# Altium schematic sheet S8_Usb_Select.SchDoc
size 420 x 297 mm; SheetNumber: 8; SheetTotal: 11
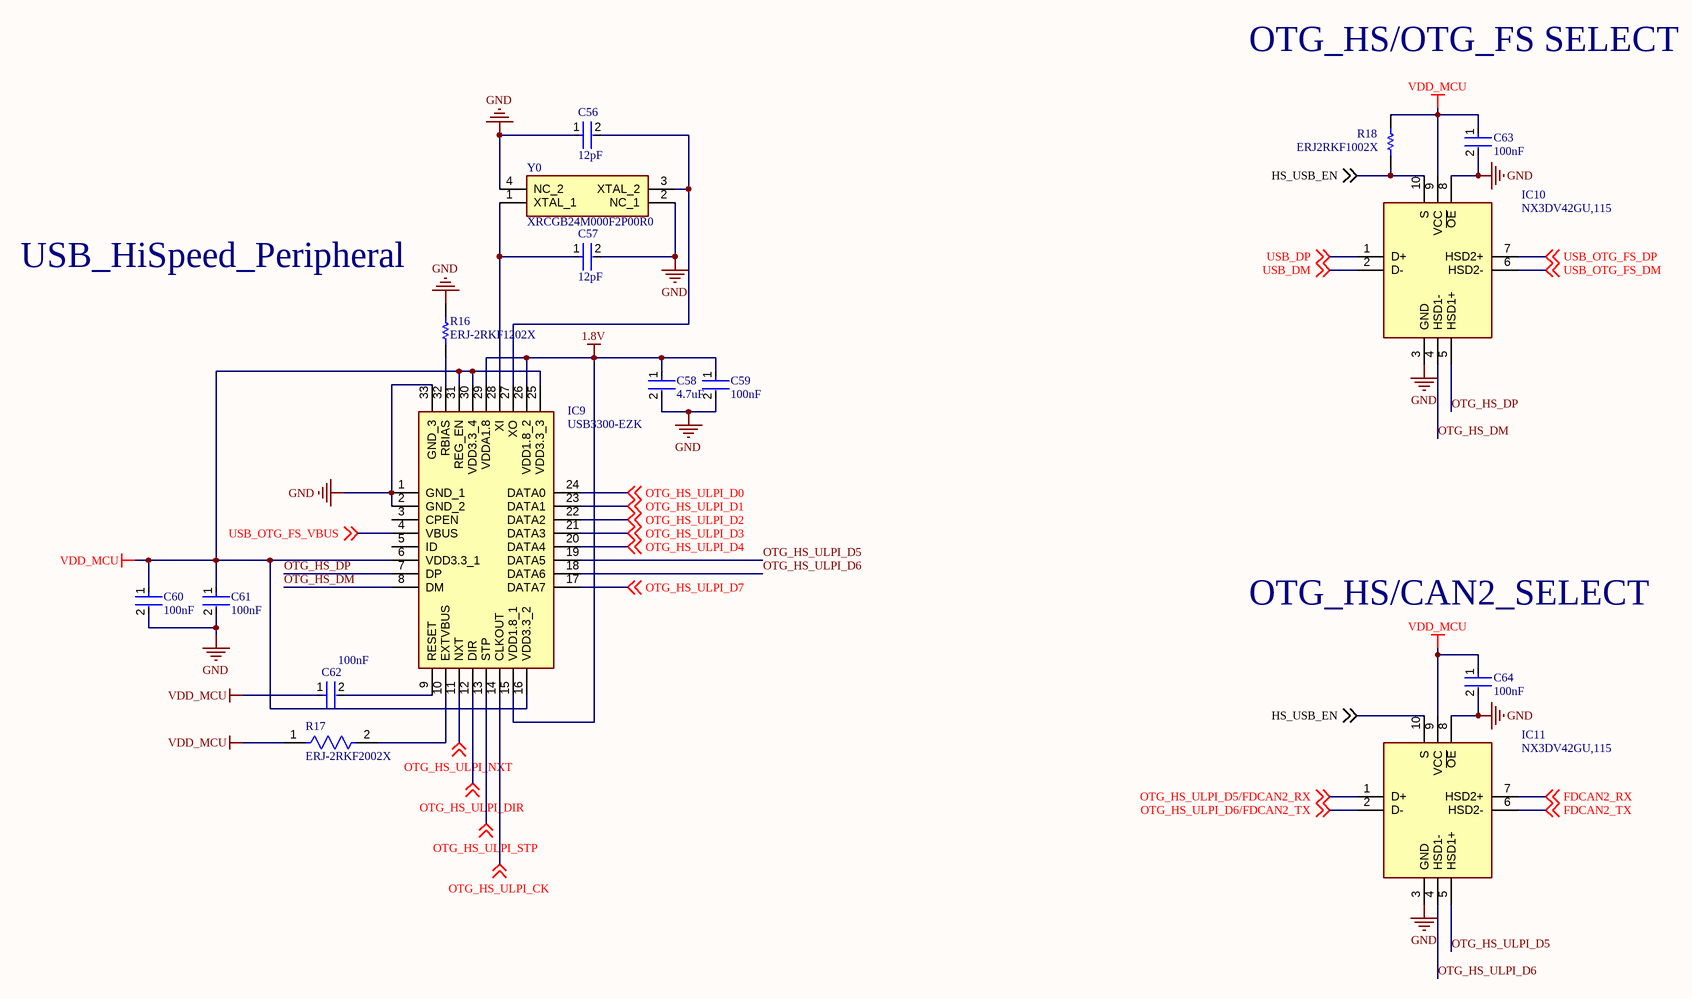
[diagram p0: S8_Usb_Select.SchDoc]

## Parts
C56  12pF  [FP-GRM155-0_05-MFG]
C57  12pF  [FP-GRM155-0_05-MFG]
C58  4.7uF  [FP-CC0402-MFG]
C59  100nF  [FP-CC0402-MFG]
C60  100nF  [FP-CC0402-MFG]
C61  100nF  [FP-CC0402-MFG]
C62  100nF  [FP-CC0402-MFG]
C63  100nF  [FP-CC0402-MFG]
C64  100nF  [FP-CC0402-MFG]
IC9  USB3300-EZK  [QFN50P500X500X100-33N-D]
IC10  NX3DV42GU,115  [QFN40P140X180X50-10N]
IC11  NX3DV42GU,115  [QFN40P140X180X50-10N]
R16  ERJ-2RKF1202X  [RESC1005X40X25ML05T05]
R17  ERJ-2RKF2002X  [FP-ERJ2RK-MFG]
R18  ERJ2RKF1002X  [RESC1005X40X25LL05T05]
Y0  XRCGB24M000F2P00R0  [XRCGB]

## Nets
1.8V: C58.1 C59.1 IC9.15(VDD1.8_1) IC9.26(VDD1.8_2) IC9.29(VDDA1.8)
GND: C56.1 C57.2 C58.2 C59.2 C60.2 C61.2 C63.2 C64.2 IC9.1(GND_1) IC9.2(GND_2) IC9.33(GND_3) IC10.3(GND) IC10.8(~{OE}) IC11.3(GND) IC11.8(~{OE}) R16.2 Y0.2(NC_1) Y0.4(NC_2)
VDD_MCU: C60.1 C61.1 C62.1 C63.1 C64.1 IC9.6(VDD3.3_1) IC9.16(VDD3.3_2) IC9.25(VDD3.3_3) IC9.30(VDD3.3_4) IC9.31(REG_EN) IC10.9(VCC) IC11.9(VCC) R17.1 R18.2
FDCAN2_RX: IC11.7(HSD2+) ; off-sheet FDCAN2_RX
FDCAN2_TX: IC11.6(HSD2-) ; off-sheet FDCAN2_TX
HS_USB_EN: IC10.10(S) IC11.10(S) R18.1 ; off-sheet HS_USB_EN
OTG_HS_DM: IC9.8(DM) IC10.4(HSD1-)
OTG_HS_DP: IC9.7(DP) IC10.5(HSD1+)
OTG_HS_ULPI_CK: IC9.14(CLKOUT) ; off-sheet OTG_HS_ULPI_CK
OTG_HS_ULPI_D0: IC9.24(DATA0) ; off-sheet OTG_HS_ULPI_D0
OTG_HS_ULPI_D1: IC9.23(DATA1) ; off-sheet OTG_HS_ULPI_D1
OTG_HS_ULPI_D2: IC9.22(DATA2) ; off-sheet OTG_HS_ULPI_D2
OTG_HS_ULPI_D3: IC9.21(DATA3) ; off-sheet OTG_HS_ULPI_D3
OTG_HS_ULPI_D4: IC9.20(DATA4) ; off-sheet OTG_HS_ULPI_D4
OTG_HS_ULPI_D5: IC9.19(DATA5) IC11.5(HSD1+)
OTG_HS_ULPI_D5/FDCAN2_RX: IC11.1(D+) ; off-sheet OTG_HS_ULPI_D5/FDCAN2_RX
OTG_HS_ULPI_D6: IC9.18(DATA6) IC11.4(HSD1-)
OTG_HS_ULPI_D6/FDCAN2_TX: IC11.2(D-) ; off-sheet OTG_HS_ULPI_D6/FDCAN2_TX
OTG_HS_ULPI_D7: IC9.17(DATA7) ; off-sheet OTG_HS_ULPI_D7
OTG_HS_ULPI_DIR: IC9.12(DIR) ; off-sheet OTG_HS_ULPI_DIR
OTG_HS_ULPI_NXT: IC9.11(NXT) ; off-sheet OTG_HS_ULPI_NXT
OTG_HS_ULPI_STP: IC9.13(STP) ; off-sheet OTG_HS_ULPI_STP
USB_DM: IC10.2(D-) ; off-sheet USB_DM
USB_DP: IC10.1(D+) ; off-sheet USB_DP
USB_OTG_FS_DM: IC10.6(HSD2-) ; off-sheet USB_OTG_FS_DM
USB_OTG_FS_DP: IC10.7(HSD2+) ; off-sheet USB_OTG_FS_DP
USB_OTG_FS_VBUS: IC9.4(VBUS) ; off-sheet USB_OTG_FS_VBUS
NetC56_2: C56.2 IC9.27(XO) Y0.3(XTAL_2)
NetC57_1: C57.1 IC9.28(XI) Y0.1(XTAL_1)
NetC62_2: C62.2 IC9.9(RESET)
NetIC9_10: IC9.10(EXTVBUS) R17.2
NetIC9_32: IC9.32(RBIAS) R16.1

Not connected (* = marked no-connect by the designer): IC9 3(CPEN) 5(ID)

## Notes on the sheet
- OTG_HS/OTG_FS SELECT
- (near R16) USB_HiSpeed_Peripheral
- OTG_HS/CAN2_SELECT
- THIS DOCUMENT AND THE DATA DISCLOSED HEREIN OR
- HEREWITH IS THE PROPERTY OF ALTIUM LIMITED AND MAY
- DWG NO:
- REVISION
- REV:
- DESCRIPTION
- DATE
- APPROVED
- BE FREELY DISTRIBUTED IN WHOLE. NO RIGHTS ARE
- RESERVED OR EXPRESS OR IMPLIED WARANTEE GIVEN.
- ENG:
- APPROVALS
- PROJECT
- DSN:
- CHK:
- REFERENCE DOCUMENTS
- PROJECT REVISION:
- TITLE
- DOCUMENT REVISION:
- DESIGN ITEM:
- BOM:
- FAB DWG:
- PCB DWG:
- ASSY DWG:
- SCALE:
- A3
- SIZE
- CAGE CODE
- FILE NAME
- DWG NO.
- SHEET
- OF
- REV

## Library data of the parts
C56 C57 = CMP-2008-03945-2: CAP CER 12PF 50V C0G/NP0 0402; Tolerance: 2%; Dielectric: C0G; Material: Ceramic; Termination: SMD/SMT; Mount: Surface Mount; REACH SVHC: No SVHC; Depth: 0.5mm; Case Code (Metric): 1005; Voltage Rating: 50V; Height: 0.5mm; Voltage Rating (DC): 50V; Case Code (Imperial): 0402; Package Quantity: 10000; Construction: Flat; Thickness: 0.022inch; Length: 1mm; Min Operating Temperature: -55°C; Width: 0.5mm; Lead Free: Lead Free; Capacitance: 12pF; Case/Package: 0402; Packaging: Tape and Reel; Series: GRM; Voltage: 50V; Radiation Hardening: No; Max Operating Temperature: 125°C
C58 = CMP-1034-02137-2: CAP CER 4.7UF 6.3V X5R 0402; Manufacturer: YAGEO; Manufacturer Part Number: CC0402MRX5R5BB475; Temperature Coefficient: 30ppm/°C; Tolerance: 0.2; Automotive Grade: NA; Material: Ceramic; Automotive: No; Temperature: -55°C to +125°C; Category: Cap; Ipc Land Pattern Name: CAPC10050X50; Digikey Description: CAP CER 4.7UF 6.3V X5R 0402; ComponentLink2Description: Datasheet; Octopart: https://octopart.com/cc0402mrx5r5bb475-yageo-20021081; Mouser Description: Multilayer Ceramic Capacitors MLCC - SMD/SMT 4.7uF 6.3V X5R 20%; Device Class L1: Passive Components; Footprint Url: http://www.yageo.com/exep/pages/download/literatures/UPY-C_GEN_24.pdf; Value: 4.7 uF; Temperature Range High: +125°C; ComponentLink2URL: http://www.yageo.com/documents/recent/UPY-GP_NP0_16V-to-50V_16.pdf; Voltage Rating: 6.3 V; Height: 0.55mm; RoHS: TRUE; Package: CC0402; Device Class L3: Ceramic Capacitors; Temperature Characteristic: X5R; Temperature Range Low: -55°C; Capacitance: 4.7 uF; Device Class L2: Capacitors; Lead Free: Yes
C59-C64 = CMP-03422-001121-1: CAP CER 0.1UF 16V X7R 0402; Manufacturer: YAGEO; Manufacturer Part Number: CC0402KPX7R7BB104; Material: Ceramic; Temperature Coefficient: 30ppm/°C; Automotive Grade: NA; Tolerance: 0.1; Digikey Description: CAP CER 0.1UF 16V X7R 0402; Temperature Range Low: -55°C; Footprint Url: http://www.yageo.com/exep/pages/download/literatures/UPY-C_GEN_24.pdf; RoHS: TRUE; Device Class L3: Ceramic Capacitors; Temperature Characteristic: X7R; Capacitance: 100 nF; Package: CC0402; Device Class L1: Passive Components; Lead Free: Yes; Temperature Range High: +125°C; Category: Cap; Mouser Description: 0402 0.1 uF 16 V ±10% Tolerance X7R SMT Multilayer Ceramic Capacitor; Voltage Rating: 16 V; Value: 100 nF; ComponentLink2Description: Datasheet; Automotive: No; Octopart: https://octopart.com/cc0402kpx7r7bb104-yageo-21548559; ComponentLink2URL: http://www.yageo.com/documents/recent/UPY-GP_NP0_16V-to-50V_16.pdf; Height: 0.55mm; Device Class L2: Capacitors; Temperature: -55°C to +125°C; Ipc Land Pattern Name: CAPC10050X50
IC9 = USB3300-EZK: Integrated Circuit; Manufacturer_Name: Microchip; Datasheet Link: http://www.microchip.com/mymicrochip/filehandler.aspx?ddocname=en562663; Height: 1mm; Manufacturer_Part_Number: USB3300-EZK; Mouser Part Number: 886-USB3300-EZK; Mouser Price/Stock: https://www.mouser.co.uk/ProductDetail/Microchip-Technology/USB3300-EZK?qs=pA5MXup5wxFkdKvPjm4n2w%3D%3D; Arrow Part Number: USB3300-EZK; Arrow Price/Stock: https://www.arrow.com/en/products/usb3300-ezk/microchip-technology?region=europe
IC10 IC11 = NX3DV42GU,115: Integrated Circuit; Manufacturer_Name: NXP; Datasheet Link: http://www.nxp.com/docs/en/data-sheet/NX3DV42.pdf; Height: 0.5mm; Manufacturer_Part_Number: NX3DV42GU,115; Mouser Part Number: 771-NX3DV42GU115; Mouser Price/Stock: https://www.mouser.co.uk/ProductDetail/NXP-Semiconductors/NX3DV42GU115?qs=cbprxTG2Yq%252BinzuyAklGVQ%3D%3D; Arrow Part Number: NX3DV42GU,115; Arrow Price/Stock: https://www.arrow.com/en/products/nx3dv42gu115/nxp-semiconductors?region=nac
R16 = CMP-2002-00646-4: Chip Resistor, 12 KOhm, +/- 1%, 0.1 W, -55 to 155 degC, 0402 (1005 Metric), RoHS, Tape and Reel; Resistance: 12 KOhm; Voltage Rating: 50 V; Case\/Package: 0402; Power Rating: 100 mW; Length: 1 mm; PackageReference: 0402; DatasheetVersion: 04/2015; ComponentLink2Description: Datasheet; ComponentLink1URL: http://www.panasonic.com/; Pins: 2; Width: 0.5 mm; REACH SVHC: Yes; Packaging: Tape and Reel; Min Operating Temperature: -55 degC; Mounting Technology: Surface Mount; Max Operating Temperature: 155 degC; Case Code (Imperial): 0402; Height: 0.35 mm; Tolerance: 1%; PackageDescription: 2-Pin Surface Mount Device, Body 1 x 0.5 mm; RoHSCompliant: true; ComponentLink1Description: Manufacturer URL; Mount: Surface Mount; ComponentLink2URL: http://industrial.panasonic.com/cdbs/www-data/pdf/RDA0000/AOA0000C86.pdf; Package Quantity: 10000; Case Code (Metric): 1005; PartNumber: ERJ-2RKF1202X
R17 = CMP-2002-00759-4: RES SMD 20K OHM 1% 1/10W 0402; Resistance: 20kR; Voltage Rating (DC): 50V; Power Rating: 100mW; Temperature Coefficient: 100ppm/°C; Radiation Hardening: No; Case/Package: 0402; Case Code (Metric): 1005; Min Operating Temperature: -55°C; Termination: SMD/SMT; Package Quantity: 1; Length: 1mm; Case Code (Imperial): 0402; Lead Free: Lead Free; Height: 0.35mm; Max Operating Temperature: 155°C; Depth: 0.5mm; Number of Terminations: 2; Military Standard: Not; Max Power Dissipation: 100mW; Tolerance: 1%; Composition: Thick Film; Weight: 2.8E-05oz; Features: Automotive AEC-Q200; Voltage Rating: 50V; Contact Plating: Tin; REACH SVHC: No SVHC; Width: 0.02inch; Packaging: Cut Tape; Mount: Surface Mount
R18 = CMP-2000-07588-1: Chip Resistor, 10 KOhm, +/- 1%, 0.1 W, -55 to 155 degC, 0402 (1005 Metric), RoHS, Tape and Reel; Manufacturer: Panasonic; Power Rating: 100mW; Voltage Rating: 50V; Resistance: 10KOhm; Case\/Package: 0402; Temperature Coefficient: 100ppm\/degreesC; RoHSCompliant: True; Lead Free: LeadFree; Package Quantity: 1; Contact Plating: Tin; Length: 1mm; Radiation Hardening: No; REACH SVHC: NoSVHC; Max Operating Temperature: 155degC; Depth: 0.5mm; Case Code (Imperial): 0402; Military Standard: Not; Package Description: 2-Pin Surface Mount Device, Body 1 x 0.5 mm; Termination: SMD/SMT; Case Code (Metric): 1005; Height: 0.35mm; Packaging: TapeandReel; Voltage Rating (DC): 50V; Package Reference: 402; Number of Pins: 2; Tolerance: 1%; Mounting Technology: SurfaceMount; Width: 0.02inch; Mount: SurfaceMount; Datasheet URL: https://industrial.panasonic.com/cdbs/www-data/pdf/RDA0000/AOA0000C304.pdf; Composition: ThickFilm; Datasheet Version: 02/2017; Manufacturer URL: http://www.panasonic.com/; Max Power Dissipation: 100mW; Number of Terminations: 2; Min Operating Temperature: -55degC
Y0 = XRCGB24M000F2P00R0: Crystal or Oscillator; Manufacturer_Name: Murata Electronics; Datasheet Link: https://www.murata.com/products/productdata/8801057734686/SPEC-XRCGB24M000F2P00R0.pdf; Height: 0.7mm; Manufacturer_Part_Number: XRCGB24M000F2P00R0; Mouser Part Number: 81-XRCGB24M000F2P0R0; Mouser Price/Stock: https://www.mouser.co.uk/ProductDetail/Murata-Electronics/XRCGB24M000F2P00R0?qs=gvhpkjpQEVQGHd411wA%252BwA%3D%3D; Arrow Part Number: XRCGB24M000F2P00R0; Arrow Price/Stock: https://www.arrow.com/en/products/xrcgb24m000f2p00r0/murata-manufacturing?region=nac